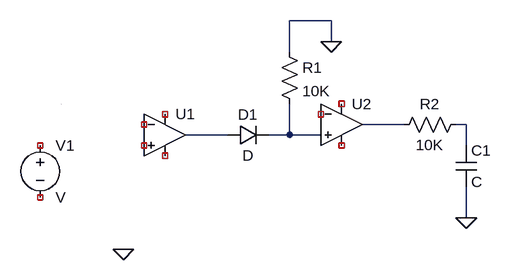
[diagram p0: schematic Draft1.asc]
Draft1.asc, the LTspice schematic file:
Version 4.1
SHEET 1 880 680
WIRE 416 -128 352 -128
WIRE 416 -96 416 -128
WIRE 352 -80 352 -128
WIRE 528 32 464 32
WIRE 624 32 608 32
WIRE 256 48 192 48
WIRE 352 48 352 0
WIRE 352 48 320 48
WIRE 400 48 352 48
WIRE 624 64 624 32
WIRE 624 176 624 128
WIRE 0 0 0 0
FLAG 96 224 0
FLAG 416 -96 0
FLAG 624 176 0
SYMBOL voltage -32 48 R0
SYMATTR InstName V1
SYMBOL res 336 -96 R0
SYMATTR InstName R1
SYMATTR Value 10K
SYMBOL res 624 16 R90
WINDOW 0 0 56 VBottom 2
WINDOW 3 32 56 VTop 2
SYMATTR InstName R2
SYMATTR Value 10K
SYMBOL cap 608 64 R0
SYMATTR InstName C1
SYMBOL diode 256 64 R270
WINDOW 0 32 32 VTop 2
WINDOW 3 0 32 VBottom 2
SYMATTR InstName D1
SYMBOL OpAmps\\UniversalOpAmp2 160 48 R0
SYMATTR InstName U1
SYMBOL OpAmps\\UniversalOpAmp2 432 32 R0
SYMATTR InstName U2

The netlist it stands for:
* Draft1.asc
V1 NC_01 NC_02 V
R1 0 N004 10K
R2 N002 N001 10K
C1 N002 0 C
D1 N003 N004 D
X§U1 NC_03 NC_04 NC_05 NC_06 N003 level2 Avol=1Meg GBW=10Meg Slew=10Meg Ilimit=25m Rail=0 Vos=0 En=0 Enk=0 In=0 Ink=0 Rin=500Meg  ; pins In+ In- V+ V- OUT
X§U2 N004 NC_07 NC_08 NC_09 N001 level2 Avol=1Meg GBW=10Meg Slew=10Meg Ilimit=25m Rail=0 Vos=0 En=0 Enk=0 In=0 Ink=0 Rin=500Meg  ; pins In+ In- V+ V- OUT
.model D D
.lib standard.dio
.lib UniversalOpAmp2.lib
.backanno
.end